# Altium schematic sheet 03.Communicate.SchDoc: 03.Communicate
size A4; Revision: V1.4; SheetNumber: 3; SheetTotal: 4; Project: TC264
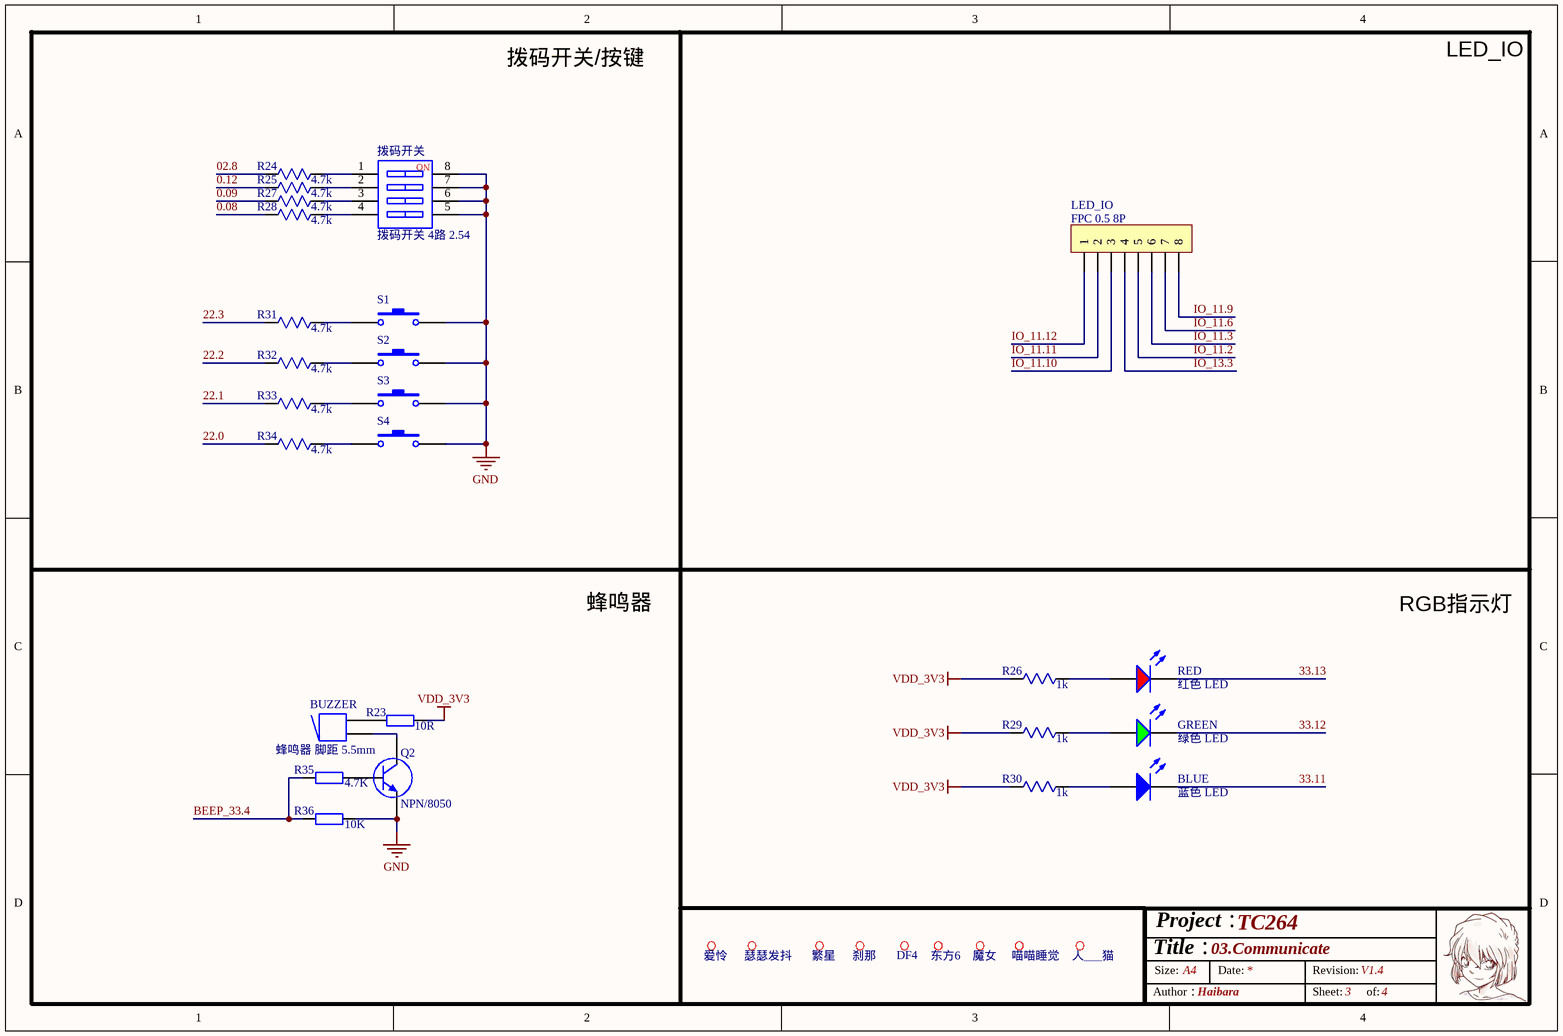
[diagram p0: 03.Communicate.SchDoc]

## Parts
(Parts that share a designator on the sheet are numbered #1, #2 ... from top to bottom, then left to right.)
?#1  爱怜  [爱怜]
?#2  瑟瑟发抖  [IMPORTED_IMAGE - duplicate6]
?#3  繁星  [繁星]
?#4  刹那  [刹那]
?#5  DF4  [DF4小]
?#6  魔女  [魔女小]
?#7  喵喵睡觉  [喵喵睡觉]
?#8  人___猫  [IMPORTED_IMAGE - duplicate2]
?#9  东方6  [IMPORTED_IMAGE - duplicate12]
BLUE  蓝色 LED  [0603 LED B]
BUZZER  蜂鸣器 脚距 5.5mm  [蜂鸣器5.5mm脚距]
GREEN  绿色 LED  [0603 LED G]
LED_IO  FPC 0.5 8P  [FPC0.5 2H-WS-8P]
Q2  NPN/8050  [SOT232-3 三极管]
R23  value 10R  [0603 电阻 R3]  (hidden comment: 4.7K)
R24  4.7k  [R0603]
R25  4.7k  [R0603]
R26  1k  [R0603]
R27  4.7k  [R0603]
R28  4.7k  [R0603]
R29  1k  [R0603]
R30  1k  [R0603]
R31  4.7k  [R0603]
R32  4.7k  [R0603]
R33  4.7k  [R0603]
R34  4.7k  [R0603]
R35  4.7K  [0603 电阻 R3]
R36  value 10K  [0603 电阻 R3]  (hidden comment: 4.7K)
RED  红色 LED  [0603 LED R]
S1  SW-PB  [TSW SMD-3*6*2.5]  (value not drawn)
S2  SW-PB  [TSW SMD-3*6*2.5]  (value not drawn)
S3  SW-PB  [TSW SMD-3*6*2.5]  (value not drawn)
S4  SW-PB  [TSW SMD-3*6*2.5]  (value not drawn)
拨码开关  拨码开关 4路 2.54  [CSW DIP-2P_G]

## Nets
GND: Q2.2(E) R36.2 S1.2 S2.2 S3.2 S4.2 拨码开关.5 拨码开关.6 拨码开关.7 拨码开关.8
VDD_3V3: R23.2 R26.1 R29.1 R30.1
0.08: R28.1
0.09: R27.1
0.12: R25.1
02.8: R24.1
22.0: R34.1
22.1: R33.1
22.2: R32.1
22.3: R31.1
33.11: BLUE.2
33.12: GREEN.2
33.13: RED.2
BEEP_33.4: R35.1 R36.1
IO_11.2: LED_IO.5
IO_11.3: LED_IO.6
IO_11.6: LED_IO.7
IO_11.9: LED_IO.8
IO_11.10: LED_IO.3
IO_11.11: LED_IO.2
IO_11.12: LED_IO.1
IO_13.3: LED_IO.4
NetBLUE_1: BLUE.1 R30.2
NetBUZZER_1: BUZZER.1 R23.1
NetBUZZER_2: BUZZER.2 Q2.3(C)
NetGREEN_1: GREEN.1 R29.2
NetQ2_1: Q2.1(B) R35.2
NetR24_2: R24.2 拨码开关.1
NetR25_2: R25.2 拨码开关.2
NetR26_2: R26.2 RED.1
NetR27_2: R27.2 拨码开关.3
NetR28_2: R28.2 拨码开关.4
NetR31_2: R31.2 S1.1
NetR32_2: R32.2 S2.1
NetR33_2: R33.2 S3.1
NetR34_2: R34.2 S4.1

## Notes on the sheet
- 拨码开关/按键
- LED_IO
- 蜂鸣器
- RGB指示灯
- Title：
- Size:
- Project：
- A4
- Date:
- Revision:
- Author：
- Haibara
- Sheet:
- of:
- (in symbol CSW-4P) NO

## Library data of the parts
BLUE = 蓝灯: 发光二极管; ComponentLink1Description: 供应商链接; ComponentLink1URL: http://www.szlcsc.com/product/details_2666.html; Package: 0805; Supplier: LC; SuppliersPartNumber: C2293
BUZZER = Buzzer: Magnetic Transducer Buzzer; Published: 24-Mar-1999; LatestRevisionDate: 17-Dec-2003; LatestRevisionNote: Schematic revised, PCB Footprint replaced.; DatasheetVersion: 17-Dec-2003; PackageReference: ABSM-1574; Publisher: Altium Limited; PackageDescription: Magnetic Transducer Buzzer; ComponentLink1Description: Manufacturer Link; ComponentLink1URL: http://www.megastar.com/linecard/buzzmode/index.php
GREEN = 绿灯: 发光二极管; ComponentLink1Description: 供应商链接; ComponentLink1URL: http://www.szlcsc.com/product/details_2670.html; Package: 0805; Supplier: LC; SuppliersPartNumber: C2297
LED_IO = Header 8: 8P接插件; 版权归属: 封装库来自淘宝 ID：黄晶宝石; BOM名称: 8P接插件; 学习资源: https://shop463601444.taobao.com
R23 R35 R36 = Res2: Resistor; Published: 8-Jun-2000; LatestRevisionDate: 17-Jul-2002; LatestRevisionNote: Re-released for DXP Platform.; PackageReference: AXIAL-0.4; Publisher: Altium Limited; PackageDescription: Axial Device, Thru-Hole; 2 Leads; 0.4 in Pin Spacing
  R35: Value: 4.7K
R24-R34 = 电阻
RED = 红灯: 发光二极管; ComponentLink1Description: 供应商链接; ComponentLink1URL: http://www.szlcsc.com/product/details_2668.html; Package: 0805; Supplier: LC; SuppliersPartNumber: C2295
S1-S4 = SW-PB: Switch; Published: 24-Mar-1999; LatestRevisionDate: 17-Jul-2002; LatestRevisionNote: Re-released for DXP Platform.; PackageReference: SPST-2; Publisher: Altium Limited; PackageDescription: Switch; 2 Leads
拨码开关 = CSW-4P: 4路编码开关; 版权归属: 源创客; BOM名称: 4路编码开关; 学习资源: www.ooocke.com